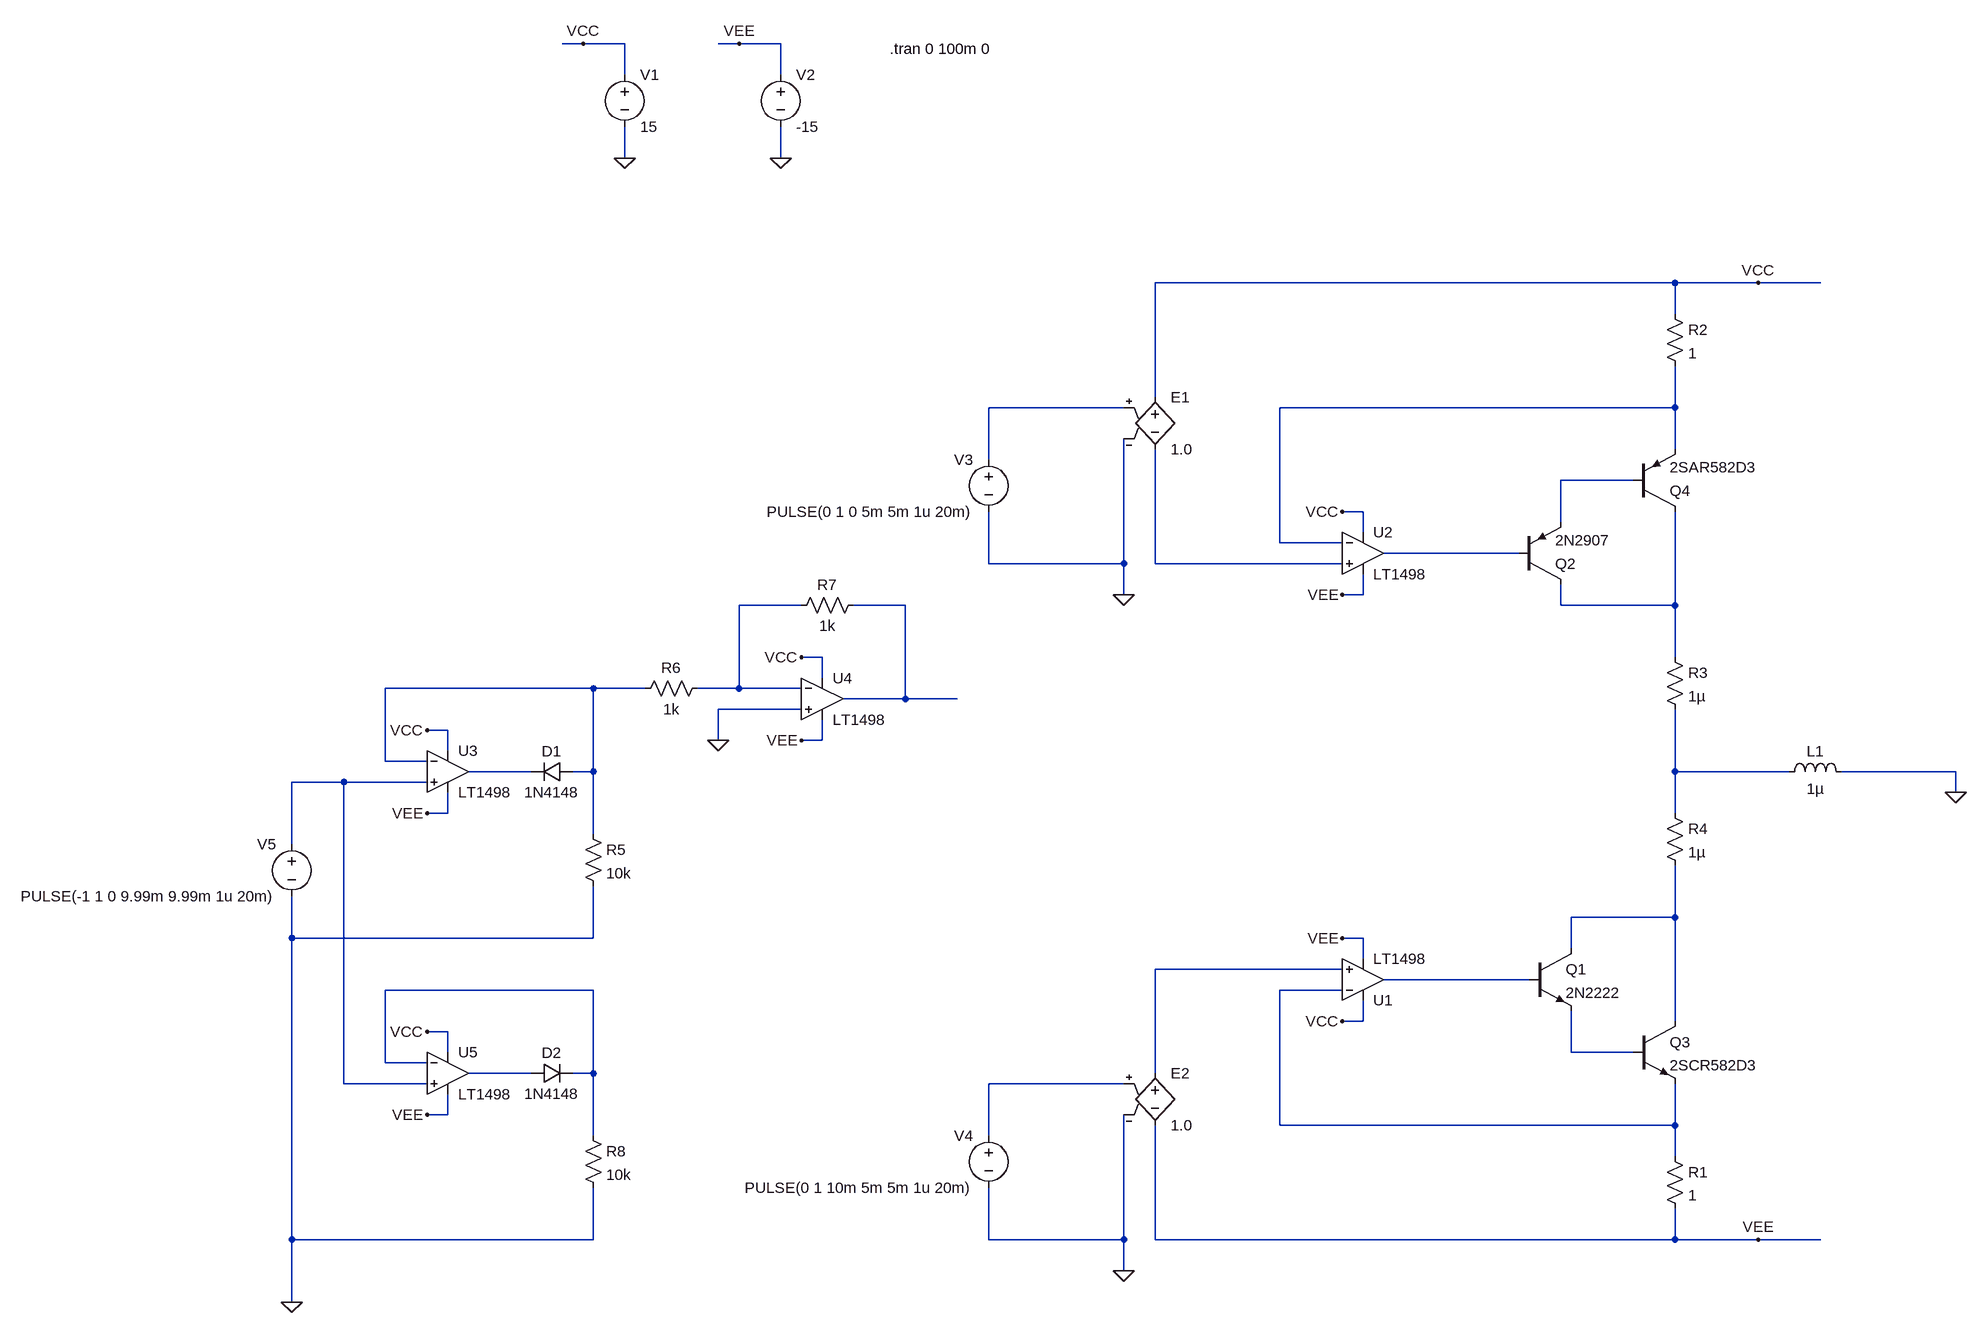
[diagram p0: schematic Constant_dI_dt_Circuit.asc]
Constant_dI_dt_Circuit.asc, the LTspice schematic file:
Version 4.1
SHEET 1 2372 1936
WIRE 80 -48 48 -48
WIRE 144 -48 80 -48
WIRE 320 -48 288 -48
WIRE 384 -48 320 -48
WIRE 144 0 144 -48
WIRE 384 0 384 -48
WIRE 144 128 144 80
WIRE 384 128 384 80
WIRE 1760 320 960 320
WIRE 1888 320 1760 320
WIRE 1984 320 1888 320
WIRE 1760 368 1760 320
WIRE 960 496 960 320
WIRE 912 512 704 512
WIRE 1760 512 1760 448
WIRE 1760 512 1152 512
WIRE 1760 576 1760 512
WIRE 704 592 704 512
WIRE 1696 624 1584 624
WIRE 1280 672 1248 672
WIRE 1584 688 1584 624
WIRE 1280 704 1280 672
WIRE 1152 720 1152 512
WIRE 1248 720 1152 720
WIRE 1520 736 1312 736
WIRE 704 752 704 672
WIRE 912 752 912 560
WIRE 912 752 704 752
WIRE 960 752 960 576
WIRE 1248 752 960 752
WIRE 912 800 912 752
WIRE 1280 800 1280 768
WIRE 1280 800 1248 800
WIRE 416 816 320 816
WIRE 576 816 496 816
WIRE 1584 816 1584 784
WIRE 1760 816 1760 672
WIRE 1760 816 1584 816
WIRE 448 896 416 896
WIRE 1760 896 1760 816
WIRE 448 928 448 896
WIRE 96 944 -224 944
WIRE 176 944 96 944
WIRE 320 944 320 816
WIRE 320 944 256 944
WIRE 416 944 320 944
WIRE 576 960 576 816
WIRE 576 960 480 960
WIRE 656 960 576 960
WIRE 416 976 288 976
WIRE -128 1008 -160 1008
WIRE 288 1024 288 976
WIRE 448 1024 448 992
WIRE 448 1024 416 1024
WIRE -128 1040 -128 1008
WIRE -224 1056 -224 944
WIRE -160 1056 -224 1056
WIRE 0 1072 -96 1072
WIRE 96 1072 96 944
WIRE 96 1072 64 1072
WIRE 1760 1072 1760 976
WIRE 1936 1072 1760 1072
WIRE 2192 1072 2016 1072
WIRE -288 1088 -368 1088
WIRE -160 1088 -288 1088
WIRE 2192 1104 2192 1072
WIRE -128 1136 -128 1104
WIRE -128 1136 -160 1136
WIRE 1760 1136 1760 1072
WIRE 96 1168 96 1072
WIRE -368 1184 -368 1088
WIRE 1760 1296 1760 1216
WIRE 1760 1296 1600 1296
WIRE -368 1328 -368 1264
WIRE 96 1328 96 1248
WIRE 96 1328 -368 1328
WIRE 1280 1328 1248 1328
WIRE 1600 1344 1600 1296
WIRE 1280 1360 1280 1328
WIRE 1248 1376 960 1376
WIRE 1536 1392 1312 1392
WIRE 96 1408 -224 1408
WIRE 1248 1408 1152 1408
WIRE 1280 1456 1280 1424
WIRE 1280 1456 1248 1456
WIRE 1760 1456 1760 1296
WIRE -128 1472 -160 1472
WIRE -128 1504 -128 1472
WIRE 1600 1504 1600 1440
WIRE 1696 1504 1600 1504
WIRE -224 1520 -224 1408
WIRE -160 1520 -224 1520
WIRE 0 1536 -96 1536
WIRE 96 1536 96 1408
WIRE 96 1536 64 1536
WIRE 960 1536 960 1376
WIRE -288 1552 -288 1088
WIRE -160 1552 -288 1552
WIRE 912 1552 704 1552
WIRE -128 1600 -128 1568
WIRE -128 1600 -160 1600
WIRE 1152 1616 1152 1408
WIRE 1760 1616 1760 1552
WIRE 1760 1616 1152 1616
WIRE 96 1632 96 1536
WIRE 704 1632 704 1552
WIRE 1760 1664 1760 1616
WIRE -368 1792 -368 1328
WIRE 96 1792 96 1712
WIRE 96 1792 -368 1792
WIRE 704 1792 704 1712
WIRE 912 1792 912 1600
WIRE 912 1792 704 1792
WIRE 960 1792 960 1616
WIRE 1760 1792 1760 1744
WIRE 1760 1792 960 1792
WIRE 1888 1792 1760 1792
WIRE 1984 1792 1888 1792
WIRE 912 1840 912 1792
WIRE -368 1888 -368 1792
FLAG 144 128 0
FLAG 384 128 0
FLAG 80 -48 VCC
FLAG 320 -48 VEE
FLAG 1248 800 VEE
FLAG 1248 672 VCC
FLAG 1248 1328 VEE
FLAG 1248 1456 VCC
FLAG 1888 1792 VEE
FLAG 1888 320 VCC
FLAG 912 1840 0
FLAG 912 800 0
FLAG 2192 1104 0
FLAG -160 1136 VEE
FLAG -160 1008 VCC
FLAG -368 1888 0
FLAG 416 1024 VEE
FLAG 416 896 VCC
FLAG 288 1024 0
FLAG -160 1600 VEE
FLAG -160 1472 VCC
SYMBOL voltage 144 -16 R0
WINDOW 123 0 0 Left 0
WINDOW 39 0 0 Left 0
SYMATTR InstName V1
SYMATTR Value 15
SYMBOL voltage 384 -16 R0
WINDOW 123 0 0 Left 0
WINDOW 39 0 0 Left 0
SYMATTR InstName V2
SYMATTR Value -15
SYMBOL npn 1536 1344 R0
SYMATTR InstName Q1
SYMATTR Value 2N2222
SYMBOL pnp 1520 784 M180
SYMATTR InstName Q2
SYMATTR Value 2N2907
SYMBOL npn 1696 1456 R0
SYMATTR InstName Q3
SYMATTR Value 2SCR582D3
SYMBOL pnp 1696 672 M180
SYMATTR InstName Q4
SYMATTR Value 2SAR582D3
SYMBOL OpAmps\\LT1498 1280 672 R0
SYMATTR InstName U2
SYMBOL OpAmps\\LT1498 1280 1456 M180
SYMATTR InstName U1
SYMBOL res 1744 1648 R0
SYMATTR InstName R1
SYMATTR Value 1
SYMBOL res 1744 352 R0
SYMATTR InstName R2
SYMATTR Value 1
SYMBOL ind 1920 1088 R270
WINDOW 0 32 56 VTop 2
WINDOW 3 5 56 VBottom 2
SYMATTR InstName L1
SYMATTR Value 1µ
SYMATTR SpiceLine Rser=1m
SYMBOL e 960 480 R0
SYMATTR InstName E1
SYMATTR Value 1.0
SYMBOL e 960 1520 R0
SYMATTR InstName E2
SYMATTR Value 1.0
SYMBOL voltage 704 576 M0
WINDOW 123 0 0 Left 0
WINDOW 39 0 0 Left 0
SYMATTR InstName V3
SYMATTR Value PULSE(0 1 0 5m 5m 1u 20m)
SYMBOL voltage 704 1616 M0
WINDOW 123 0 0 Left 0
WINDOW 39 0 0 Left 0
SYMATTR InstName V4
SYMATTR Value PULSE(0 1 10m 5m 5m 1u 20m)
SYMBOL res 1744 880 R0
SYMATTR InstName R3
SYMATTR Value 1µ
SYMBOL res 1744 1120 R0
SYMATTR InstName R4
SYMATTR Value 1µ
SYMBOL OpAmps\\LT1498 -128 1008 R0
SYMATTR InstName U3
SYMBOL diode 64 1056 R90
WINDOW 0 0 32 VBottom 2
WINDOW 3 32 32 VTop 2
SYMATTR InstName D1
SYMATTR Value 1N4148
SYMBOL res 80 1152 R0
SYMATTR InstName R5
SYMATTR Value 10k
SYMBOL OpAmps\\LT1498 448 896 R0
SYMATTR InstName U4
SYMBOL res 272 928 R90
WINDOW 0 0 56 VBottom 2
WINDOW 3 32 56 VTop 2
SYMATTR InstName R6
SYMATTR Value 1k
SYMBOL res 512 800 R90
WINDOW 0 0 56 VBottom 2
WINDOW 3 32 56 VTop 2
SYMATTR InstName R7
SYMATTR Value 1k
SYMBOL voltage -368 1168 M0
WINDOW 123 0 0 Left 0
WINDOW 39 0 0 Left 0
SYMATTR InstName V5
SYMATTR Value PULSE(-1 1 0 9.99m 9.99m 1u 20m)
SYMBOL OpAmps\\LT1498 -128 1472 R0
SYMATTR InstName U5
SYMBOL diode 0 1552 R270
WINDOW 0 32 32 VTop 2
WINDOW 3 0 32 VBottom 2
SYMATTR InstName D2
SYMATTR Value 1N4148
SYMBOL res 80 1616 R0
SYMATTR InstName R8
SYMATTR Value 10k
TEXT 552 -40 Left 2 !.tran 0 100m 0

The netlist it stands for:
* Constant_dI_dt_Circuit.asc
V1 VCC 0 15
V2 VEE 0 -15
Q1 N013 N015 N018 0 2N2222
Q2 N008 N004 N003 0 2N2907
Q3 N013 N018 N017 0 2SCR582D3
Q4 N008 N003 N002 0 2SAR582D3
X§U2 N005 N002 VCC VEE N004 LT1498  ; pins In+ In- V+ V- OUT
X§U1 N014 N017 VCC VEE N015 LT1498  ; pins In+ In- V+ V- OUT
R1 N017 VEE 1
R2 VCC N002 1
L1 N011 0 1µ Rser=1m
E1 VCC N005 N001 0 1.0
E2 N014 VEE N020 0 1.0
V3 N001 0 PULSE(0 1 0 5m 5m 1u 20m)
V4 N020 0 PULSE(0 1 10m 5m 5m 1u 20m)
R3 N008 N011 1µ
R4 N011 N013 1µ
X§U3 N012 N009 VCC VEE N010 LT1498  ; pins In+ In- V+ V- OUT
D1 N009 N010 1N4148
R5 N009 0 10k
X§U4 0 N006 VCC VEE N007 LT1498  ; pins In+ In- V+ V- OUT
R6 N006 N009 1k
R7 N007 N006 1k
V5 N012 0 PULSE(-1 1 0 9.99m 9.99m 1u 20m)
X§U5 N012 N016 VCC VEE N019 LT1498  ; pins In+ In- V+ V- OUT
D2 N019 N016 1N4148
R8 N016 0 10k
.model D D
.lib standard.dio
.model NPN NPN
.model PNP PNP
.lib standard.bjt
.tran 0 100m 0
.lib LTC.lib
.backanno
.end